# Altium schematic sheet Лист 1.SchDoc
size 420 x 297 mm; ListNumber: 1; ApprovedBy: Татаринов В.С.; CheckedBy: Ломака П.С.; Author: Татаринов Д.В.; CompanyName: ООО "Амаринго"; SheetNumber: 1; SheetTotal: 2; PageSetup: Record=PageOptions|CenterHorizontal=True|CenterVertical=True|PrintScale=0.94|XCorrection=1.00|YCorrection=1.00|PrintKind=1|BorderSize=5000000|LeftOffset=0|BottomOffset=0|Orientation=1|PaperLength=1000|PaperWidth=1000|Scale=100|PaperSource=7|PrintQuality=-4|MediaType=1|DitherType=10|PaperKind=A4|PrintScaleMode=1; DecimalNumber: АНГМ.436437.002Э3; Name: Силовая плата контроллера заряда MPPT; DocumentName: Sheet1.SCHDOC
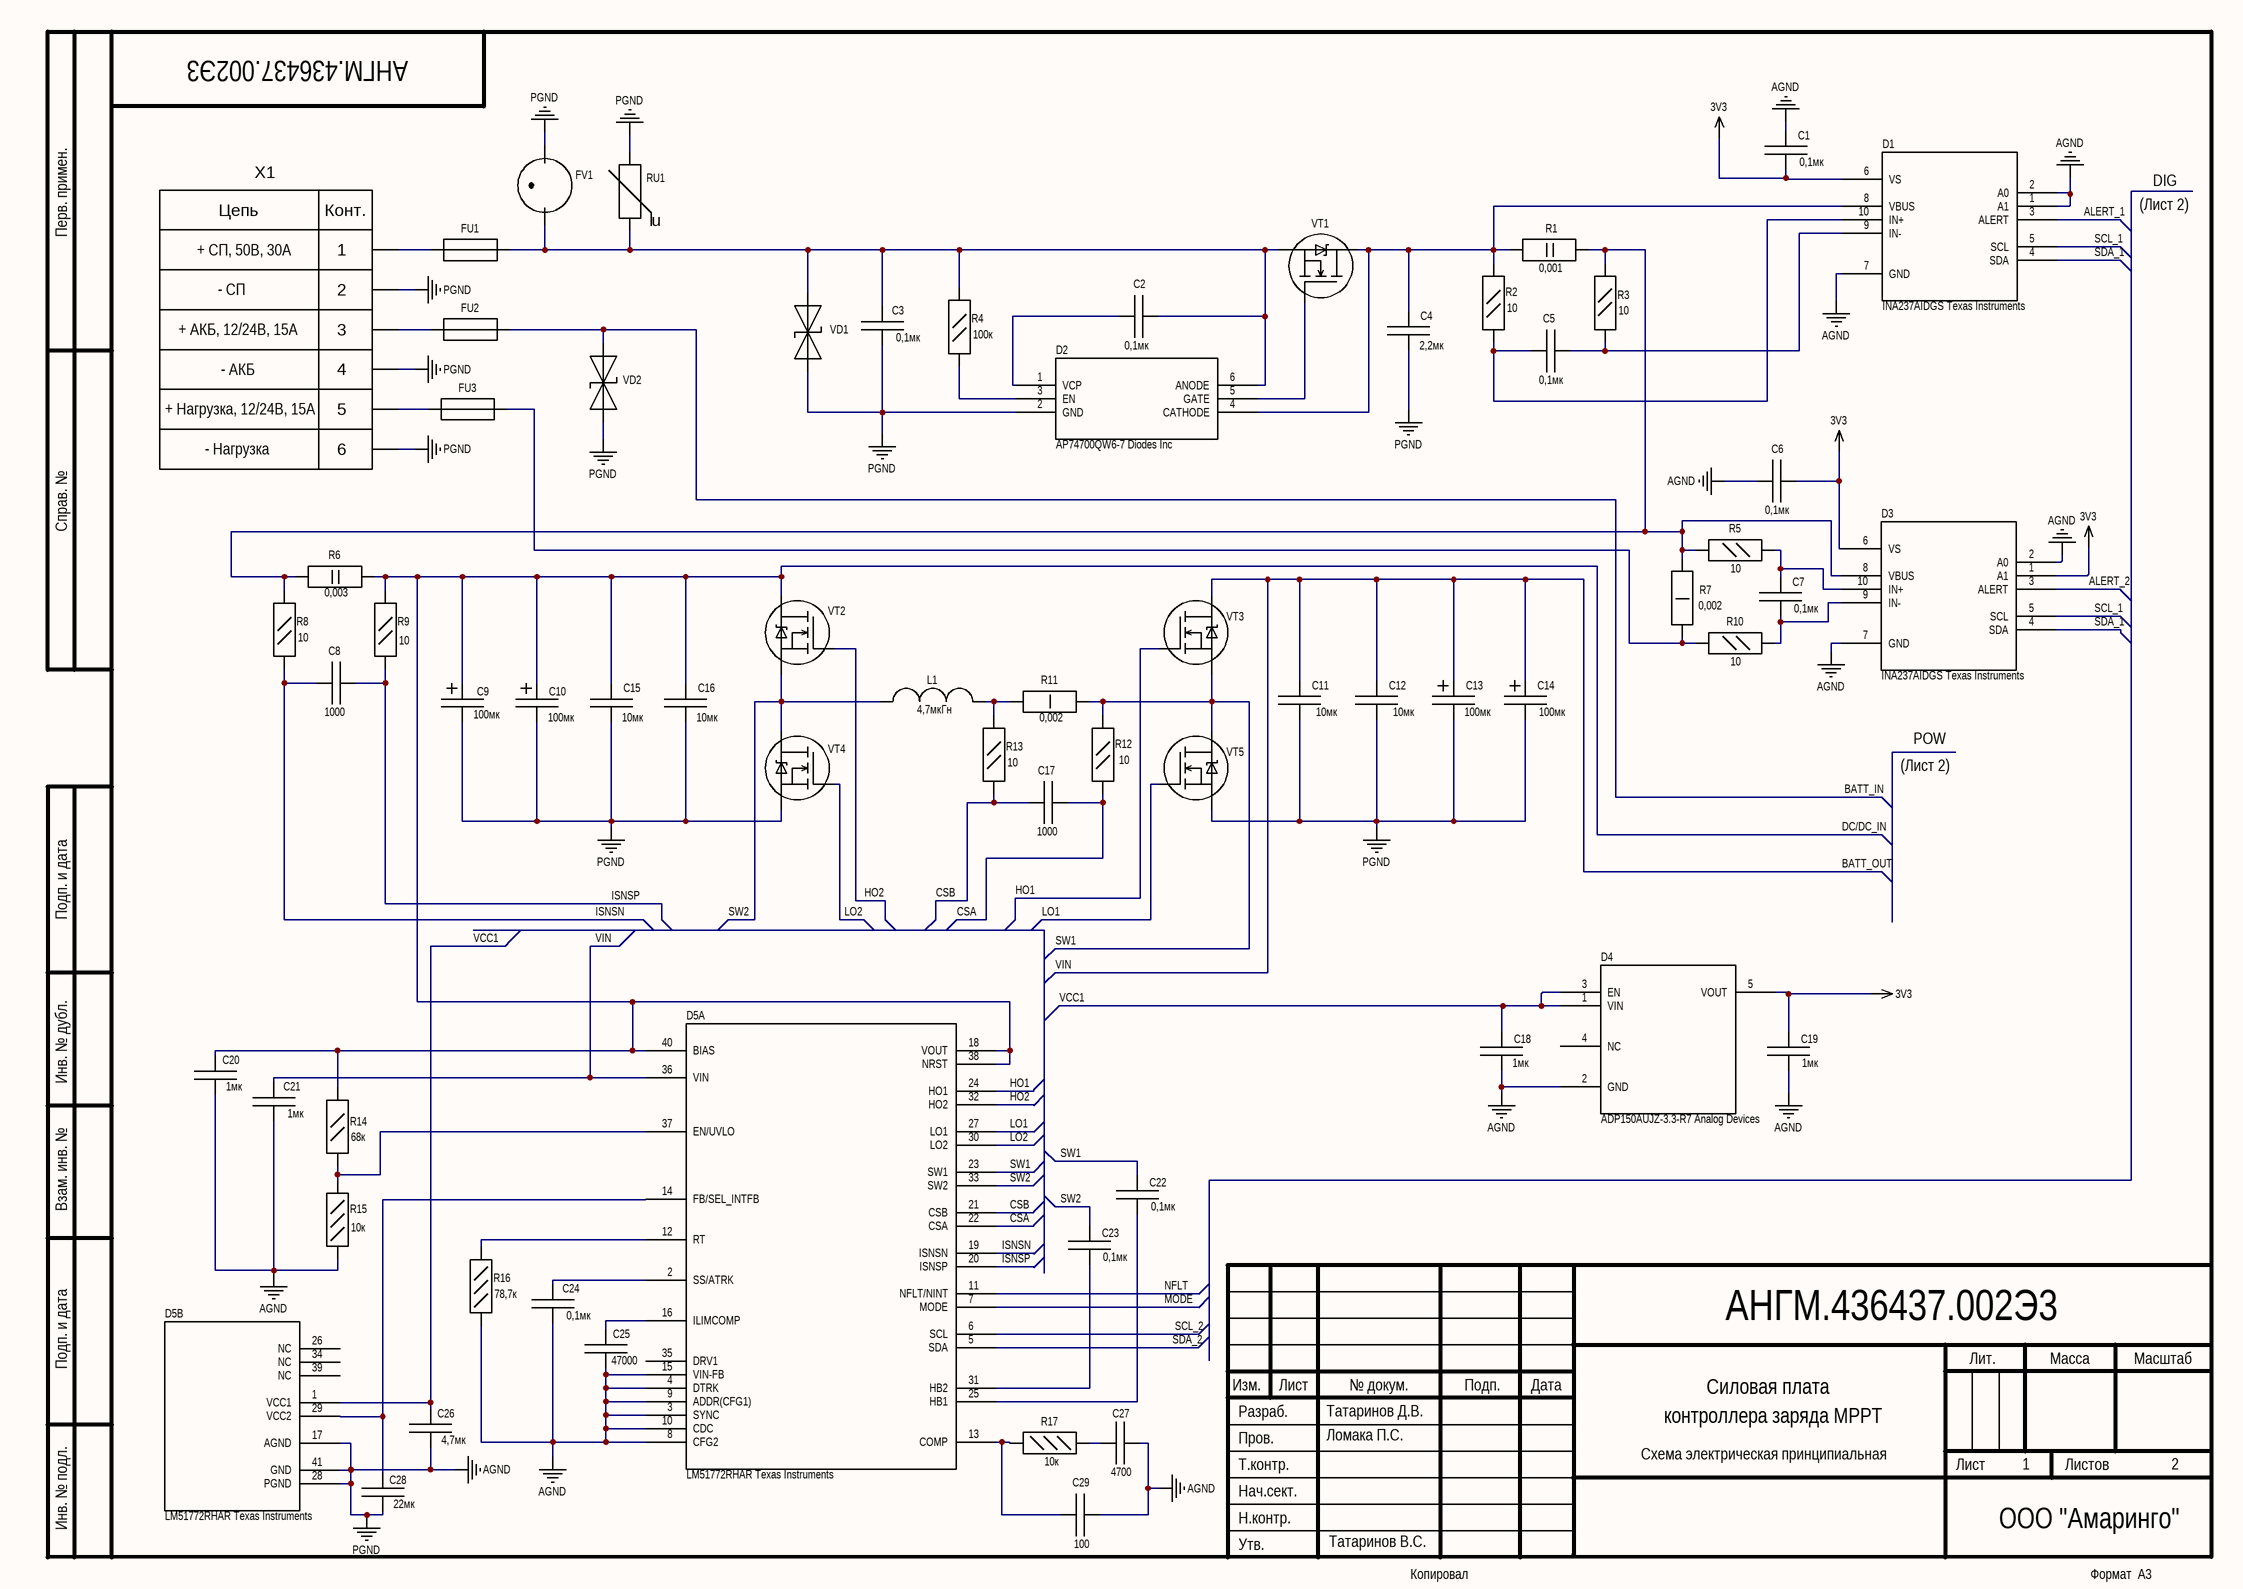
[diagram p0: Лист 1.SchDoc]

## Parts
C1  Capacitance: 0,1мк  [CC0603]  (hidden comment: CL10B104KO8NNNC Samsung Electronics)
C2  Capacitance: 0,1мк  [CC0805]  (hidden comment: CC0805KKX7R0BB104 Yageo)
C3  Capacitance: 0,1мк  [CC0805]  (hidden comment: CC0805KKX7R0BB104 Yageo)
C4  Capacitance: 2,2мк  [CC1206]  (hidden comment: CC1206KKX7R0BB225 Yageo)
C5  Capacitance: 0,1мк  [CC0805]  (hidden comment: CC0805KKX7R0BB104 Yageo)
C6  Capacitance: 0,1мк  [CC0603]  (hidden comment: CL10B104KO8NNNC Samsung Electronics)
C7  Capacitance: 0,1мк  [CC0805]  (hidden comment: CC0805KKX7R0BB104 Yageo)
C8  Capacitance: 1000  [CC0603]  (hidden comment: GRM1885C1H102JA01D Murata Electronics)
C9  Capacitance: 100мк  [EEUFC2A101]  (hidden comment: 100ZLH100MEFC10x20 Rubycon)
C10  Capacitance: 100мк  [EEUFC2A101]  (hidden comment: 100ZLH100MEFC10x20 Rubycon)
C11  Capacitance: 10мк  [CC2220]  (hidden comment: 2220B106K101N05 Hitano)
C12  Capacitance: 10мк  [CC2220]  (hidden comment: 2220B106K101N05 Hitano)
C13  Capacitance: 100мк  [EEUFC2A101]  (hidden comment: 100ZLH100MEFC10x20 Rubycon)
C14  Capacitance: 100мк  [EEUFC2A101]  (hidden comment: 100ZLH100MEFC10x20 Rubycon)
C15  Capacitance: 10мк  [CC2220]  (hidden comment: 2220B106K101N05 Hitano)
C16  Capacitance: 10мк  [CC2220]  (hidden comment: 2220B106K101N05 Hitano)
C17  Capacitance: 1000  [CC0603]  (hidden comment: GRM1885C1H102JA01D Murata Electronics)
C18  Capacitence: 1мк  [CC0201]  (hidden comment: CC0201MRX5R6BB105 Yageo)
C19  Capacitence: 1мк  [CC0201]  (hidden comment: CC0201MRX5R6BB105 Yageo)
C20  Capacitance: 1мк  [CC0603]  (hidden comment: CC0603KRX7R9BB105 Yageo)
C21  Capacitance: 1мк  [CC0603]  (hidden comment: CC0603KRX7R9BB105 Yageo)
C22  Capacitance: 0,1мк  [CC0805]  (hidden comment: CC0805KKX7R0BB104 Yageo)
C23  Capacitance: 0,1мк  [CC0805]  (hidden comment: CC0805KKX7R0BB104 Yageo)
C24  Capacitance: 0,1мк  [CC0603]  (hidden comment: CL10B104KO8NNNC Samsung Electronics)
C25  Capacitance: 47000  [CC0402]  (hidden comment: CC0402KRX7R7BB473 Yageo)
C26  Capacitance: 4,7мк  [CC0805]  (hidden comment: CC0805KKX7R7BB475 Yageo)
C27  Capacitance: 4700  [CC0603]  (hidden comment: CC0603JRX7R9BB472 Yageo)
C28  Capacitance: 22мк  [CC1206]  (hidden comment: GRM31CR61C226KE15L Murata Electronics)
C29  Capacitance: 100  [CC0603]  (hidden comment: CC0603JRNPO9BN101 Yageo)
D1  INA237AIDGS Texas Instruments  [VSSOP]
D2  AP74700QW6-7 Diodes Inc  [SOT26]
D3  INA237AIDGS Texas Instruments  [VSSOP]
D4  ADP150AUJZ-3.3-R7 Analog Devices  [TSOT (UJ-5)]
D5  LM51772RHAR Texas Instruments  [LM51772]  (parts A,B of 2)
FU1  FT40A.50 Tesla  [3522-2_KEY]  (value not drawn)
FU2  0287020L Littelfuse  [3522-2_KEY]  (value not drawn)
FU3  0287020L Littelfuse  [3522-2_KEY]  (value not drawn)
FV1  B88069X1380S102 EPCOS  [B88069X1380S102 EPCOS]  (value not drawn)
L1  Inductance: 4,7мкГн  [SRP1770TA]  (hidden comment: SRP1770TA-4R7M Bourns)
R1  Resistance: 0,001  [RC2512]  (hidden comment: PMR100HZPFV1L00 Pohm)
R2  Resistance: 10  [RC0805]  (hidden comment: RC0805JR-0710RL Yageo)
R3  Resistance: 10  [RC0805]  (hidden comment: RC0805JR-0710RL Yageo)
R4  Resistance: 100к  [RC0805]  (hidden comment: RC0805JR-07100KL Yageo)
R5  Resistance: 10  [RC0805]  (hidden comment: RC0805JR-0710RL Yageo)
R6  Resistance: 0,003  [RC2512]  (hidden comment: FMF25FPJR003-BH Prosperity Dielectrics)
R7  Resistance: 0,002  [RC2512]  (hidden comment: RLM25FECR002 TA-I)
R8  Resistance: 10  [RC0805]  (hidden comment: RC0805JR-0710RL Yageo)
R9  Resistance: 10  [RC0805]  (hidden comment: RC0805JR-0710RL Yageo)
R10  Resistance: 10  [RC0805]  (hidden comment: RC0805JR-0710RL Yageo)
R11  Resistance: 0,002  [RC2512]  (hidden comment: RLM25FECR002 TA-I)
R12  Resistance: 10  [RC0805]  (hidden comment: RC0805JR-0710RL Yageo)
R13  Resistance: 10  [RC0805]  (hidden comment: RC0805JR-0710RL Yageo)
R14  Resistance: 68к  [RC0805]  (hidden comment: RC0805FR-0768KL Yageo)
R15  Resistance: 10к  [RC0201]  (hidden comment: RC0201FR-0710KL Yageo)
R16  Resistance: 78,7к  [RC0201]  (hidden comment: RC0201FR-0778K7L Yageo)
R17  Resistance: 10к  [RC0201]  (hidden comment: RC0201FR-0710KL Yageo)
RU1  Варистор 14D680K Yageo  [14D680K]  (value not drawn)
VD1  SMCJ51CA Littelfuse  [DO-214AB]  (value not drawn)
VD2  SMCJ30CA Hottech  [DO-214AB]  (value not drawn)
VT1  IRFS7730TRL7PP Infineon Technologies  [D2PAK-7PIN]  (value not drawn)
VT2  NTMFS5C628NLT1G ON Semiconductor  [DFN5 (SO-8FL)]  (value not drawn)
VT3  NTMFS5C628NLT1G ON Semiconductor  [DFN5 (SO-8FL)]  (value not drawn)
VT4  NTMFS5C628NLT1G ON Semiconductor  [DFN5 (SO-8FL)]  (value not drawn)
VT5  NTMFS5C628NLT1G ON Semiconductor  [DFN5 (SO-8FL)]  (value not drawn)
X1  DG78H-A-06P-13-00A(H) Degson Electronics  [DG78H-A-06P-13-00A(H)]  (value not drawn)

## Nets
3V3: C1.2 C6.2 C19.2 D1.6(VS) D3.1(A1) D3.6(VS) D4.5(VOUT)
AGND: C1.1 C3.1 C4.2 C6.1 C9.1 C10.1 C11.1 C12.1 C13.1 C14.1 C15.2 C16.2 C18.1 C19.1 C20.1 C21.1 C24.2 C25.2 C26.2 C27.2 C28.1 C29.2 D1.1(A1) D1.2(A0) D1.7(GND) D2.2(GND) D3.2(A0) D3.7(GND) D4.2(GND) D5.3(SYNC) D5.4(DTRK) D5.8(CFG2) D5.9(ADDR(CFG1)) D5.10(CDC) D5.15(VIN-FB) D5.17(AGND) D5.28(PGND) D5.41(GND) FV1.2 R15.2 R16.2 RU1.2 VD1.1 VD2.2 VT4.3(s) VT5.3(s) X1.2 X1.4 X1.6  [also labelled PGND]
ALERT_1: D1.3(ALERT)
ALERT_2: D3.3(ALERT)
BATT_IN: FU2.2 VD2.1
BATT_OUT: C11.2 C12.2 C13.2 C14.2 C21.2 D5.36(VIN) VT3.2(d)  [also labelled VIN]
CSA: C17.2 D5.22(CSA) R12.2
CSB: C17.1 D5.21(CSB) R13.2
DC/DC_IN: C9.2 C10.2 C15.1 C16.1 C20.2 D5.18(VOUT) D5.38(NRST) D5.40(BIAS) R6.2 R9.1 R14.1 VT2.2(d)
HO1: D5.24(HO1) VT3.1(g)
HO2: D5.32(HO2) VT2.1(g)
ISNSN: C8.1 D5.19(ISNSN) R8.2
ISNSP: C8.2 D5.20(ISNSP) R9.2
LO1: D5.27(LO1) VT5.1(g)
LO2: D5.30(LO2) VT4.1(g)
MODE: D5.7(MODE)
NFLT: D5.11(NFLT/NINT)
SCL_1: D1.5(SCL) D3.5(SCL)
SCL_2: D5.6(SCL)
SDA_1: D1.4(SDA) D3.4(SDA)
SDA_2: D5.5(SDA)
SW1: C22.2 D5.23(SW1) R11.2 R12.1 VT3.3(s) VT5.2(d)
SW2: C23.2 D5.33(SW2) L1.1 VT2.3(s) VT4.2(d)
VCC1: C18.2 C26.1 D4.1(VIN) D4.3(EN) D5.1(VCC1)
NetC2_1: C2.1 D2.1(VCP)
NetC2_2: C2.2 C3.2 D2.6(ANODE) FU1.2 FV1.1 R4.1 RU1.1 VD1.2 VT1.3(s)
NetC4_1: C4.1 D1.8(VBUS) D2.4(CATHODE) R1.1 R2.1 VT1.2(d)
NetC5_1: C5.1 D1.10(IN+) R2.2
NetC5_2: C5.2 D1.9(IN-) R3.1
NetC7_1: C7.1 D3.10(IN+) R5.2
NetC7_2: C7.2 D3.9(IN-) R10.2
NetC22_1: C22.1 D5.25(HB1)
NetC23_1: C23.1 D5.31(HB2)
NetC24_1: C24.1 D5.2(SS/ATRK)
NetC25_1: C25.1 D5.16(ILIMCOMP)
NetC27_1: C27.1 R17.2
NetC28_2: C28.2 D5.14(FB/SEL_INTFB) D5.29(VCC2)
NetC29_1: C29.1 D5.13(COMP) R17.1
NetD2_3: D2.3(EN) R4.2
NetD2_5: D2.5(GATE) VT1.1(g)
NetD3_8: D3.8(VBUS) R1.2 R3.2 R5.1 R6.1 R7.1 R8.1
NetD5_12: D5.12(RT) R16.1
NetD5_37: D5.37(EN/UVLO) R14.2 R15.1
NetFU1_1: FU1.1 X1.1
NetFU2_1: FU2.1 X1.3
NetFU3_1: FU3.1 X1.5
NetFU3_2: FU3.2 R7.2 R10.1
NetL1_2: L1.2 R11.1 R13.1

Not connected (* = marked no-connect by the designer): D4 4(NC); D5 26(NC) 34(NC) 35(DRV1) 39(NC)

## Notes on the sheet
- DIG
- + СП, 50В, 30А
- (Лист 2)
- - СП
- + АКБ, 12/24В, 15А
- - АКБ
- (near X1) + Нагрузка, 12/24В, 15А
- - Нагрузка
- POW
- 2
- Перв. примен.
- Справ. №
- Подп. и дата
- Инв. № дубл.
- Взам. инв. №
- Разраб.
- Изм.
- Лист
- № докум.
- Подп.
- Дата
- Силовая плата
- Лит.
- Масса
- Масштаб
- Т.контр.
- Пров.
- контроллера заряда MPPT
- Схема электрическая принципиальная
- Листов
- Инв. № подл.
- Утв.
- Н.контр.
- Нач.сект.
- Копировал
- Формат  A3
- (in symbol R_U) u
- (in symbol X_6) Цепь; Конт.

## Library data of the parts
C1 C4 C6-C8 C11 C12 C15 C16 C24 C27 = C: ComponentKind: Конденсатор
  C1 C6 C24: Наименование: CL10B104KO8NNNC Samsung Electronics; Manufacturer: Samsung Electronics; PartNumber: CL10B104KO8NNNC
  C4: Наименование: CC1206KKX7R0BB225 Yageo; Manufacturer: Yageo; PartNumber: CC1206KKX7R0BB225
  C7: Наименование: CC0805KKX7R0BB104 Yageo; Manufacturer: Yageo; PartNumber: CC0805KKX7R0BB104
  C8: Наименование: GRM1885C1H102JA01D Murata Electronics; Manufacturer: Murata Electronics; PartNumber: GRM1885C1H102JA01D
  C11 C12 C15 C16: Наименование: 2220B106K101N05 Hitano; Manufacturer: Hitano; PartNumber: 2220B106K101N05
  C27: Наименование: CC0603JRX7R9BB472 Yageo; Manufacturer: Yageo; PartNumber: CC0603JRX7R9BB472
C2 = C: Керамический, 50В, X7R; ComponentKind: Конденсатор; Наименование: CC0805KKX7R0BB104 Yageo; Manufacturer: Yageo; PartNumber: CC0805KKX7R0BB104
C3 = C: Керамический, 100В, X7R; ComponentKind: Конденсатор; Наименование: CC0805KKX7R0BB104 Yageo; Manufacturer: Yageo; PartNumber: CC0805KKX7R0BB104
C5 C17 = C: Керамический; ComponentKind: Конденсатор
  C5: Наименование: CC0805KKX7R0BB104 Yageo; Manufacturer: Yageo; PartNumber: CC0805KKX7R0BB104
  C17: Наименование: GRM1885C1H102JA01D Murata Electronics; Manufacturer: Murata Electronics; PartNumber: GRM1885C1H102JA01D
C9 C10 C13 C14 = C_POL: ComponentKind: Конденсатор; Наименование: 100ZLH100MEFC10x20 Rubycon; Manufacturer: Rubycon; PartNumber: 100ZLH100MEFC10x20
C18 = C: Керами; ComponentKind: Конденсатор; Наименование: CC0201MRX5R6BB105 Yageo; Manufacturer: Yageo; PartNumber: CC0201MRX5R6BB105
C19 = C: Керамический, от 10В; ComponentKind: Конденсатор; Наименование: CC0201MRX5R6BB105 Yageo; Manufacturer: Yageo; PartNumber: CC0201MRX5R6BB105
C20 C21 = C: Керамический, 50В; ComponentKind: Конденсатор; Наименование: CC0603KRX7R9BB105 Yageo; Manufacturer: Yageo; PartNumber: CC0603KRX7R9BB105
C22 C23 = C: Керамика, 50В; ComponentKind: Конденсатор; Наименование: CC0805KKX7R0BB104 Yageo; Manufacturer: Yageo; PartNumber: CC0805KKX7R0BB104
C25 = C: Керамический, X7R или NP0/COG; ComponentKind: Конденсатор; Наименование: CC0402KRX7R7BB473 Yageo; Manufacturer: Yageo; PartNumber: CC0402KRX7R7BB473
C26 = C: Керамический, X7R, 10-16В; ComponentKind: Конденсатор; Наименование: CC0805KKX7R7BB475 Yageo; Manufacturer: Yageo; PartNumber: CC0805KKX7R7BB475
C28 = C: Керамический, X7R (X5R), 10-16В; ComponentKind: Конденсатор; Наименование: GRM31CR61C226KE15L Murata Electronics; Manufacturer: Murata Electronics; PartNumber: GRM31CR61C226KE15L
C29 = C: Керамический, NP0 (COG); ComponentKind: Конденсатор; Наименование: CC0603JRNPO9BN101 Yageo; Manufacturer: Yageo; PartNumber: CC0603JRNPO9BN101
D1 D3 = INA237AIDGSR: 85-V, 16-bit, I2C output current/voltage/power monitor with alert 10-VSSOP -40 to 125; Copyright: Copyright (C) 2026 Ultra Librarian. All rights reserved.; Manufacturer_Name: Texas Instruments; Manufacturer_Part_Number: INA237AIDGSR; RefDes: RefDes; Type: Type; ComponentKind: Микросхема; Наименование: INA237AIDGS Texas Instruments; Manufacturer: Texas Instruments; PartNumber: INA237AIDGS
D2 = AP74700QW6-7: Description; Copyright: Copyright (C) 2025 Ultra Librarian. All rights reserved.; Manufacturer_Name: Diodes Inc; Manufacturer_Part_Number: AP74700QW6-7; RefDes: RefDes; Type: Type; ComponentKind: Микросхема; Наименование: AP74700QW6-7 Diodes Inc; Manufacturer: Diodes Inc; PartNumber: AP74700QW6-7
D4 = ADP150AUJZ-3.3-R7: Ultralow Noise, 150 mA CMOS Linear Regulator; Manufacturer_Name: Analog Devices Inc; Copyright: Copyright (C) 2025 Ultra Librarian. All rights reserved.; Manufacturer_Part_Number: ADP150AUJZ-3.3-R7; RefDes: RefDes; Type: Type; ComponentKind: Микросхема; Наименование: ADP150AUJZ-3.3-R7 Analog Devices; Manufacturer: Analog Devices; PartNumber: ADP150AUJZ-3.3-R7
D5 = LM51772RHAR: 55V wide VIN four-switch buck-boost controller with I2C interface 40-VQFN -40 to 125; Copyright: Copyright (C) 2025 Ultra Librarian. All rights reserved.; Manufacturer_Name: Texas Instruments; Manufacturer_Part_Number: LM51772RHAR; RefDes: RefDes; Type: Type; ComponentKind: Микросхема; Наименование: LM51772RHAR Texas Instruments; Manufacturer: Texas Instruments; PartNumber: LM51772RHAR
FU1 = FU: 40А; ComponentKind: Предохранитель; Наименование: FT40A.50 Tesla; Manufacturer: Tesla; PartNumber: FT40A.50
FU2 FU3 = FU: 20А; ComponentKind: Предохранитель; Наименование: 0287020L Littelfuse; Manufacturer: Littelfuse; PartNumber: 0287020L
FV1 = FV: ComponentKind: Разрядник; Наименование: B88069X1380S102 EPCOS; Manufacturer: EPCOS; PartNumber: B88069X1380S102
L1 = L: ComponentKind: Дроссель; Наименование: SRP1770TA-4R7M Bourns; Manufacturer: Bourns; PartNumber: SRP1770TA-4R7M
R1 = R_2W: Корпус 2512 или 2816; Power: 2 Вт; Tolerance: 1%; Value: 1 мОм; ComponentKind: Резистор; Type: RC2512; Наименование: PMR100HZPFV1L00 Pohm; Manufacturer: Pohm; PartNumber: PMR100HZPFV1L00
R2 R3 R8 R9 R12 R13 = R_0,125W: Корпус 0603; Power: 0,125 Вт; Tolerance: 5%; Value: 10 Ом; ComponentKind: Резистор; Type: RC0805; Наименование: RC0805JR-0710RL Yageo; Manufacturer: Yageo; PartNumber: RC0805JR-0710RL
R4 = R_0,125W: Корпус 0603; Power: 0,125 Вт; Tolerance: 5%; Value: 100 кОм; ComponentKind: Резистор; Type: RC0805; Наименование: RC0805JR-07100KL Yageo; Manufacturer: Yageo; PartNumber: RC0805JR-07100KL
R5 R10 = R_0,125W: Power: 0,125 Вт; Tolerance: 5%; Value: 10 Ом; ComponentKind: Резистор; Type: RC0805; Наименование: RC0805JR-0710RL Yageo; Manufacturer: Yageo; PartNumber: RC0805JR-0710RL
R6 = R_2W: Корпус 2512; Power: 2 Вт; Tolerance: 1%; Value: 3 мОм; ComponentKind: Резистор; Type: RC2512; Наименование: FMF25FPJR003-BH Prosperity Dielectrics; Manufacturer: Prosperity Dielectrics; PartNumber: FMF25FPJR003-BH
R7 R11 = R_1W: Корпус 2512; Power: 1 Вт; Tolerance: 1%; Value: 2 мОм; ComponentKind: Резистор; Type: RC2512; Наименование: RLM25FECR002 TA-I; Manufacturer: TA-I; PartNumber: RLM25FECR002
R14 = R_0,125W: Корпус 0603; Power: 0,125 Вт; Tolerance: 1%; Value: 68 кОм; ComponentKind: Резистор; Type: RC0805; Наименование: RC0805FR-0768KL Yageo; Manufacturer: Yageo; PartNumber: RC0805FR-0768KL
R15 R17 = R_0,05W: Корпус 0402; Power: 0,05 Вт; Tolerance: 1%; Value: 10 кОм; ComponentKind: Резистор; Type: RC0201; Наименование: RC0201FR-0710KL Yageo; Manufacturer: Yageo; PartNumber: RC0201FR-0710KL
R16 = R_0,05W: Корпус 0402; Power: 0,05 Вт; Tolerance: 1%; Value: 78,7 кОм; ComponentKind: Резистор; Type: RC0201; Наименование: RC0201FR-0778K7L Yageo; Manufacturer: Yageo; PartNumber: RC0201FR-0778K7L
RU1 = R_U: ComponentKind: Варистор; Наименование: 14D680K Yageo; Manufacturer: Yageo; PartNumber: 14D680K
VD1 = VD_TVS: Наименование: Диод защитный SMCJ51CA Littelfuse; ComponentKind: Диод защитный; Manufacturer: Littelfuse; PartNumber: SMCJ51CA
VD2 = VD_TVS: SMCJ33A; Наименование: Диод защитный SMCJ30CA Hottech; ComponentKind: Диод защитный; Manufacturer: Hottech; PartNumber: SMCJ30CA
VT1 = N_GDS: ComponentKind: Транзистор; Наименование: IRFS7730TRL7PP Infineon Technologies; Manufacturer: Infineon Technologies; PartNumber: IRFS7730TRL7PP
VT2-VT5 = N_GDS: Наименование: Транзистор NTMFS5C628NLT1G ON Semiconductor; ComponentKind: Транзистор; Manufacturer: ON Semiconductor; PartNumber: NTMFS5C628NLT1G
X1 = X_6: ComponentKind: Клеммник; Наименование: DG78H-A-06P-13-00A(H) Degson Electronics; Manufacturer: Degson Electronics; PartNumber: DG78H-A-06P-13-00A(H)